# Altium schematic sheet KPILL.SchDoc
size A3; SheetNumber: 1; SheetTotal: 1
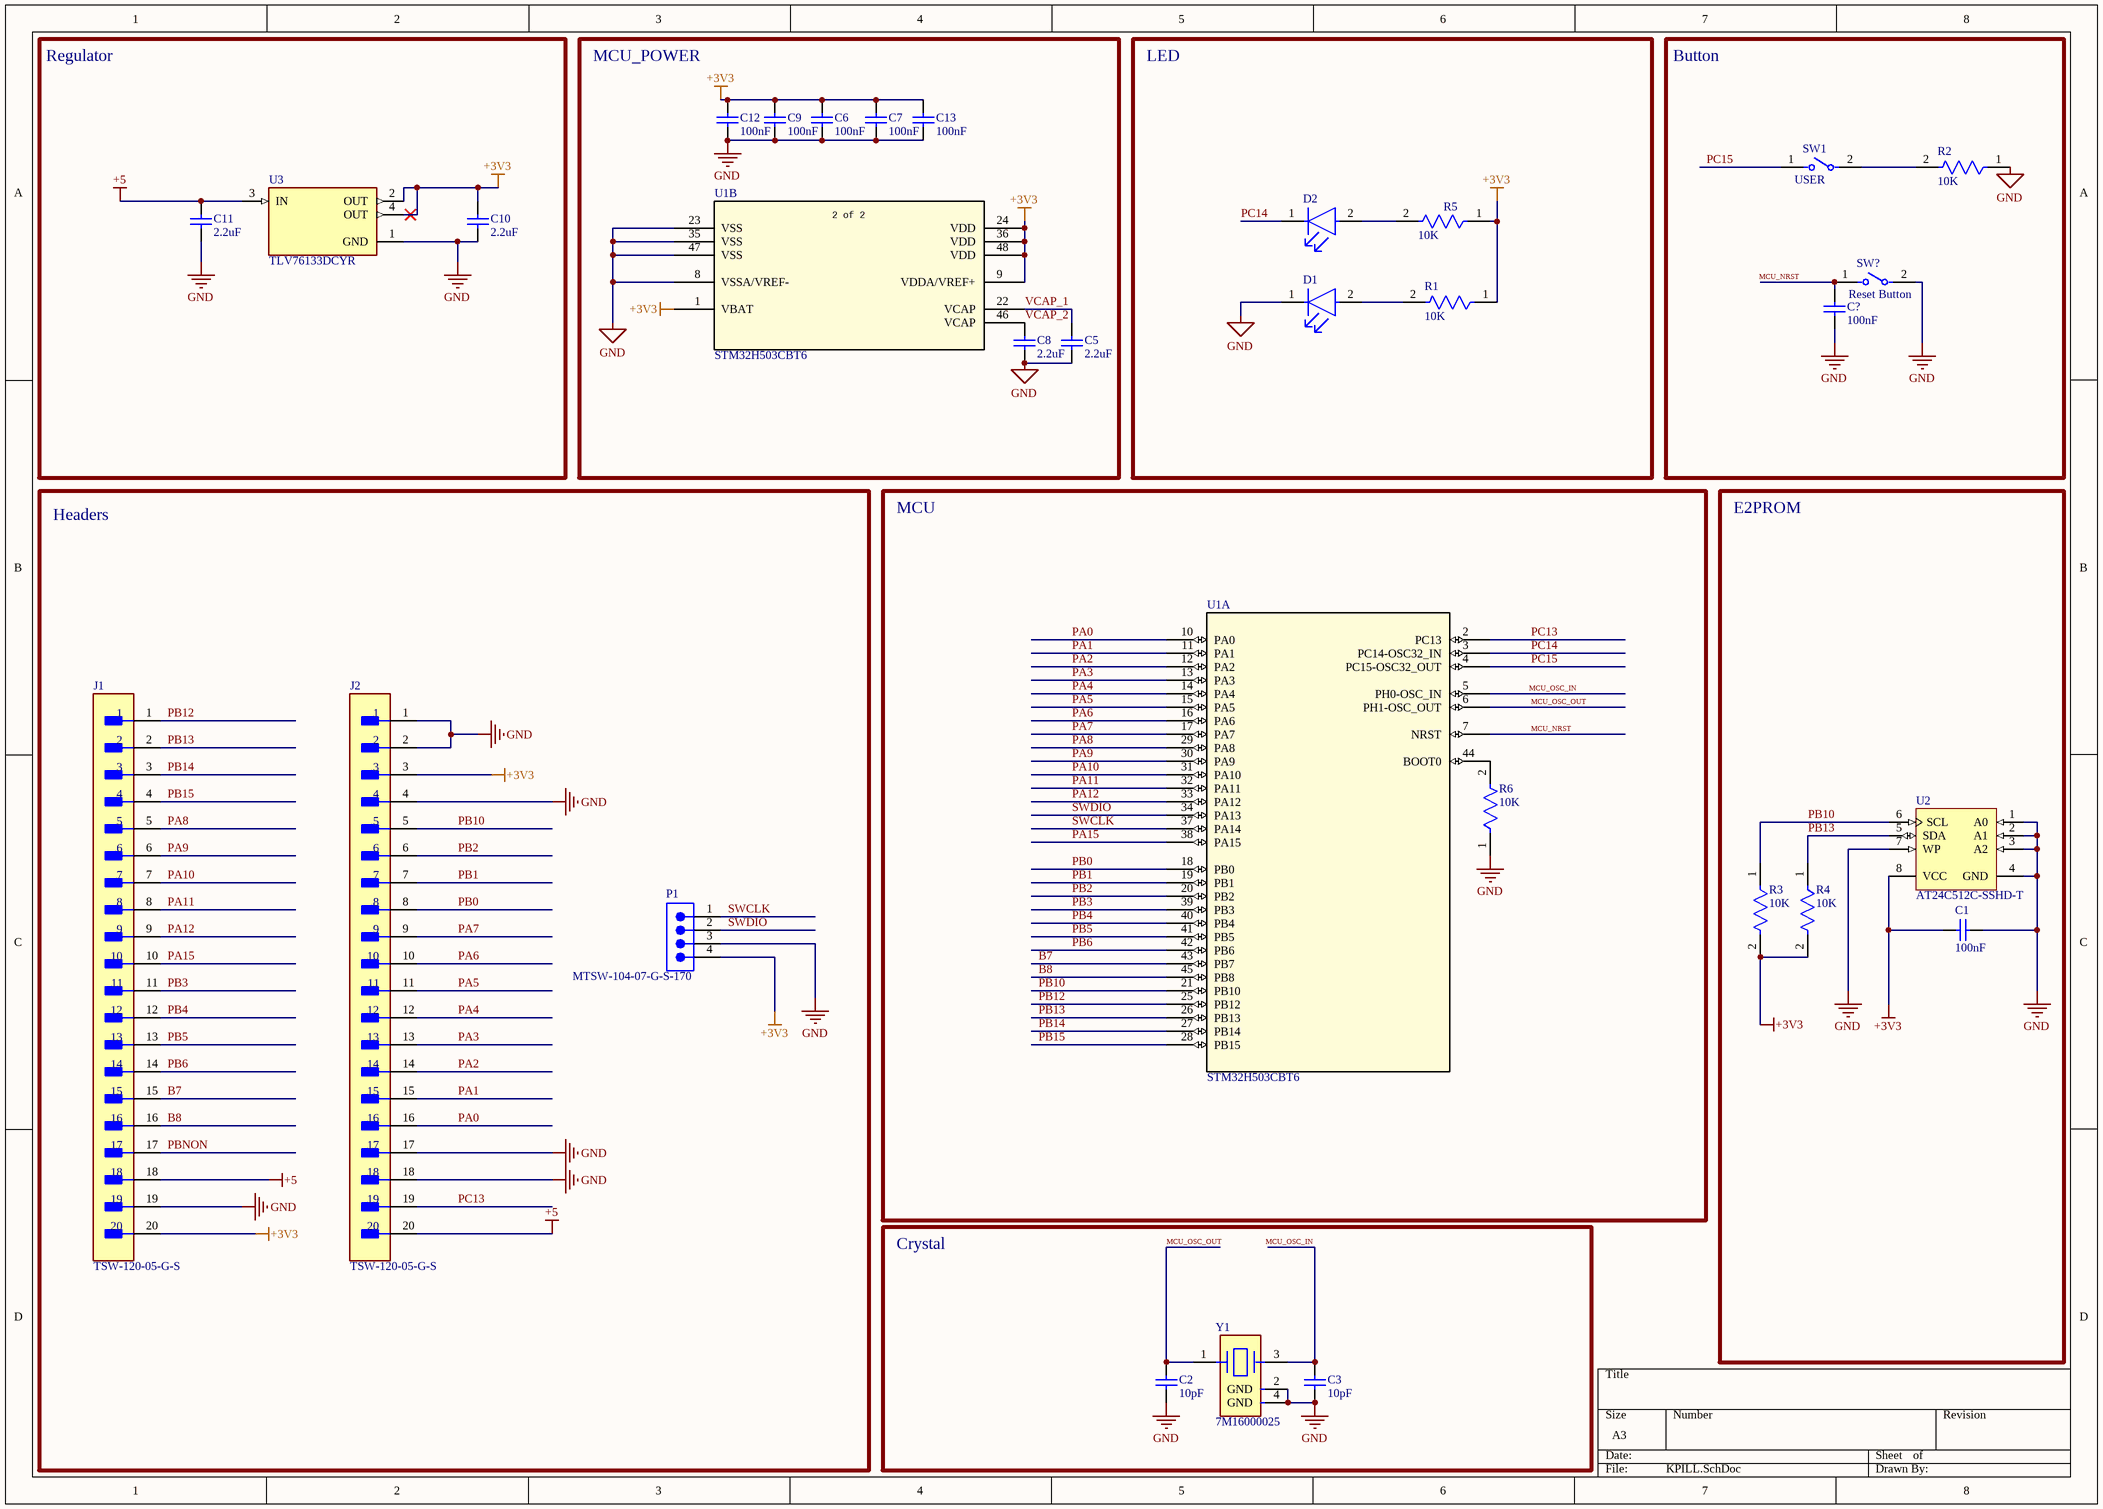
[diagram p0: KPILL.SchDoc]

## Parts
C1  100nF  [CAPC1608X90X35LL15T15]
C2  10pF  [CAPC1608X90X35LL15T15]
C3  10pF  [CAPC1608X90X35LL15T15]
C5  2.2uF  [CAPC1608X90X35LL15T15]
C6  100nF  [CAPC1608X90X35LL15T15]
C7  100nF  [CAPC1608X90X35LL15T15]
C8  2.2uF  [CAPC1608X90X35LL15T15]
C9  100nF  [CAPC1608X90X35LL15T15]
C10  2.2uF  [CAPC1608X90X35LL15T15]
C11  2.2uF  [CAPC1608X90X35LL15T15]
C12  100nF  [CAPC1608X90X35LL15T15]
C13  100nF  [CAPC1608X90X35LL15T15]
C?  100nF  [CAPC1608X90X35LL15T15]
D1  SML-LX0805UWC-TR  [FP-SML-LX0805UWC-TR-MFG]  (value not drawn)
D2  SML-LX0805UWC-TR  [FP-SML-LX0805UWC-TR-MFG]  (value not drawn)
J1  TSW-120-05-G-S  [FP-TSW-120-05-G-S-MFG]
J2  TSW-120-05-G-S  [FP-TSW-120-05-G-S-MFG]
P1  MTSW-104-07-G-S-170  [SMTC-MTSW-104-07-X-S-170]
R1  10K  [FP-AT0603-IPC_C]
R2  10K  [FP-AT0603-IPC_C]
R3  10K  [FP-AT0603-IPC_C]
R4  10K  [FP-AT0603-IPC_C]
R5  10K  [FP-AT0603-IPC_C]
R6  10K  [FP-AT0603-IPC_C]
SW1  USER  [FP-147873-2-MFG]
SW?  Reset Button  [FP-147873-2-MFG]
U1  STM32H503CBT6  [LQFP48-7x7mm_STM]  (parts A,B of 2)
U2  AT24C512C-SSHD-T  [ATML-8S1_L]
U3  TLV76133DCYR  [FP-DCY0004A-MFG]
Y1  7M16000025  [FP-7M-MFG]

## Blocks framed on the sheet
Regulator: C10 C11 U3
MCU_POWER: C5-C9 C12 C13 U1
LED: D1 D2 R1 R5
Button: C? R2 SW1 SW?
Headers: J1 J2 P1
MCU: R6 U1
E2PROM: C1 R3 R4 U2
Crystal: C2 C3 Y1

## Nets
+3V3: C1.2 C6.2 C7.2 C9.2 C10.2 C12.2 C13.2 J1.20 J2.3 P1.4 R1.1 R3.2 R4.2 R5.1 U1.1(VBAT) U1.9(VDDA/VREF+) U1.24(VDD) U1.36(VDD) U1.48(VDD) U2.8(VCC) U3.2(OUT) U3.4(OUT)
+5: C11.2 J1.18 J2.20 U3.3(IN)
GND: C1.1 C2.1 C3.2 C5.1 C6.1 C7.1 C8.1 C9.1 C10.1 C11.1 C12.1 C13.1 C?.2 D1.1(C) J1.19 J2.1 J2.2 J2.4 J2.17 J2.18 P1.3 R2.1 R6.1 SW?.2 U1.8(VSSA/VREF-) U1.23(VSS) U1.35(VSS) U1.47(VSS) U2.1(A0) U2.2(A1) U2.3(A2) U2.4(GND) U2.7(WP) U3.1(GND) Y1.2(GND) Y1.4(GND)
B7: J1.15 U1.43(PB7)
B8: J1.16 U1.45(PB8)
MCU_NRST: C?.1 SW?.1 U1.7(NRST)
MCU_OSC_IN: C3.1 U1.5(PH0-OSC_IN) Y1.3
MCU_OSC_OUT: C2.2 U1.6(PH1-OSC_OUT) Y1.1
PA0: J2.16 U1.10(PA0)
PA1: J2.15 U1.11(PA1)
PA2: J2.14 U1.12(PA2)
PA3: J2.13 U1.13(PA3)
PA4: J2.12 U1.14(PA4)
PA5: J2.11 U1.15(PA5)
PA6: J2.10 U1.16(PA6)
PA7: J2.9 U1.17(PA7)
PA8: J1.5 U1.29(PA8)
PA9: J1.6 U1.30(PA9)
PA10: J1.7 U1.31(PA10)
PA11: J1.8 U1.32(PA11)
PA12: J1.9 U1.33(PA12)
PA15: J1.10 U1.38(PA15)
PB0: J2.8 U1.18(PB0)
PB1: J2.7 U1.19(PB1)
PB2: J2.6 U1.20(PB2)
PB3: J1.11 U1.39(PB3)
PB4: J1.12 U1.40(PB4)
PB5: J1.13 U1.41(PB5)
PB6: J1.14 U1.42(PB6)
PB10: J2.5 R3.1 U1.21(PB10) U2.6(SCL)
PB12: J1.1 U1.25(PB12)
PB13: J1.2 R4.1 U1.26(PB13) U2.5(SDA)
PB14: J1.3 U1.27(PB14)
PB15: J1.4 U1.28(PB15)
PBNON: J1.17
PC13: J2.19 U1.2(PC13)
PC14: D2.1(C) U1.3(PC14-OSC32_IN)
PC15: SW1.1 U1.4(PC15-OSC32_OUT)
SWCLK: P1.1 U1.37(PA14)
SWDIO: P1.2 U1.34(PA13)
VCAP_1: C5.2 U1.22(VCAP)
VCAP_2: C8.2 U1.46(VCAP)
NetD1_2: D1.2(A) R1.2
NetD2_2: D2.2(A) R5.2
NetR2_2: R2.2 SW1.2
NetR6_2: R6.2 U1.44(BOOT0)

## Notes on the sheet
- (in symbol STM32H503CBT6, part B) 2 of 2

## Library data of the parts
C1-C3 C5-C13 C? = CMP-2006-04453-1: Manufacturer: AVX Interconnect / Elco; Part Number: 06035C682KAT4A
D1 D2 = CMP-00229-00139794-1: SML-LX0805UWC-TR White LED, 0805 Diffused, Rectangle Lens SMD package; NexarPartId: 139794; Approvals: CSA, UL; Lens Color: Clear, Yellow; Luminous Intensity: 150mcd; Power Rating: 120mW; Forward Current: 20mA; Forward Voltage: 3.5V; Number of LEDs: 1; Viewing Angle: 120°; RoHS: Compliant; Case/Package: 0805; Illumination Color: White; Min Operating Temperature: -40°C; Mount: Surface Mount; Max Operating Temperature: 85°C
J1 J2 = CMP-00575-00271415-1: TSW-120-05-G-S Headers & Wire Housings Classic PCB Header Strips, 0.100 pitch; NexarPartId: 271415; Manufacturer Lifecycle Status: PRODUCTION; Number of Contacts: 20; Gender: Male; Pitch: 2.54mm; Connector Type: Male Pin; Lead Free: Lead Free; Housing Material: Plastic; RoHS: Compliant; Housing Color: Black; Width: 2.54mm; Height: 2.54mm; Contact Plating: Gold; Lead Pitch: 2.54mm; Color: Black; Number of Positions: 20; Lifecycle Status: Production; Contact Material: Bronze; Contact Mating Length: 2.667mm; Length: 50.8mm; REACH SVHC: No SVHC; Termination: Solder; Mount: Through Hole; Number of Rows: 1
P1 = CMP-1024-00104-1: Modified .025" SQ Post Header, Through-hole, Vertical, -55 to 125 degC, 2.54 mm Pitch, 4-Pin, Male, RoHS; Manufacturer: Samtec; Pitch: 2.54 mm; Temperature Range: -55 to 125 degC; ComponentLink1URL: http://www.samtec.com; ComponentLink1Description: Manufacturer URL; ComponentLink3URL: http://www.samtec.com/documents/webfiles/cpdf/MTSW-XXX-XX-X-X-XXXX-XX-XXX-MKT1.pdf; DatasheetVersion: F-214; Orientation: Vertical; ComponentLink3Description: Package Specification; PackageReference: MTSW-104-07-X-S-170; PackageDescription: Assembly .025" [.64] SQ Post Terminal Strip; ComponentLink2Description: Datasheet; PackageVersion: BI, 2/1987; ComponentLink2URL: http://www.samtec.com/documents/webfiles/pdf/MTSW.PDF; PartNumber: MTSW-104-07-G-S-170; Mounting Technology: Through-hole; RoHS: True
R1-R6 = CMP-03412-014529-2: Thin Film Chip Resistors Automotive Grade 10kΩ 0.5% 50ppm/°C 0603; Resistance: 10kR; Max Power Dissipation: 100mW; Ratings: AEC-Q200; Number of Terminations: 2; Case Code (Metric): 1608; Series: AT; Length: 0.063inch; Min Operating Temperature: -55°C; Features: Moisture Resistant; Case/Package: 0603; RoHS Compliant: Yes; Temperature Coefficient: 50ppm/°C; Case Code (Imperial): 0603; Tolerance: 0.5%; Resistor Type: Thin Film; Max Operating Temperature: 155°C; Packaging: Cut Tape; Width: 0.032inch; Height: 0.022inch
SW1 SW? = CMP-03402-000024-1: SWITCH TACTILE SPST-NO 0.05A 24V; Contact Current Rating: 50mA; Mechanical Life: 40000Cycles; Actuator Length: 0.031inch; Operating Force: 1.77N; Contact Resistance: 100mR; Max Voltage Rating (DC): 12V; Illumination Type: Non-Illuminated; Switch Function: Off-Mom; Actuator Material: Polyphenylene; Throw Configuration: SPST; Switch Travel: 0.25mm; Housing Material: Thermoplastic; Package Quantity: 1; Contact Plating: Silver; Depth: 6.8mm; Electrical Life: 40000Cycles; Color: Black; Length: 3.5mm; Size: 6mm; Material: Polyamide; Height: 4.3mm; Current Rating: 50mA; Case/Package: SMD/SMT; Packaging: Tape and Reel; Mount: Surface Mount; RoHS Compliant: Yes; Voltage Rating (DC): 12V; Max Operating Temperature: 85°C; ELV: Compliant; Min Operating Temperature: -35°C; Lead Free: Lead Free; Termination: J-Bend; Orientation: Straight; Max Current Rating: 50mA; Radiation Hardening: No; Type: Switch; Contact Material: Copper Alloy; Series: FSMJM, Alcoswitch
U1 = STM32H503CBT6: High-performance, Arm Cortex-M33, MCU with 128-Kbyte Flash, 32-Kbyte RAM, 250 MHz CPU; Manufacturer_Name: STMicroelectronics; Copyright: Copyright (C) 2025 Ultra Librarian. All rights reserved.; Manufacturer_Part_Number: STM32H503CBT6; RefDes: RefDes; Type: Type
U2 = CMP-2000-05801-1: 512-Kbit (65,536 x 8), 2-Wire Bus Serial EEPROM with Write Protect, 2.5 to 5.5 V, -40 to 85 degC, 8-Pin SOIC (8S1), RoHS, Tape and Reel; Manufacturer: Atmel; Data Retention: 40Year; Maximum Random Access Time: 550ns; Maximum Operating Frequency: 1MHz; Typical Operating Supply Voltage: 3.3; Organization: 64Kx8; Hardware Data Protection: Yes; Interface Type: Serial(2-Wire); Density: 512Kb; Operating Temperature: -40to85°C; Package Reference: 8S1; Datasheet URL: http://www.atmel.com/Images/Atmel-8720-SEEPROM-AT24C512C-Datasheet.pdf; Package Description: 8-Pin Small Outline Integrated Circuit, Body 4.925 x 3.9 mm, Pitch 1.27 mm; Mounting Technology: SurfaceMount; Manufacturer URL: http://www.atmel.com/; Category: EEPROM; Package: 8SOIC; Datasheet Version: Rev. 8720G, 09/2015
U3 = CMP-00370-135533165-1: TLV76133DCYR 1A 16V high-PSRR linear voltage regulator 4-SOT-223 -40 to 125; Manufacturer Lifecycle Status: ACTIVE; Output Voltage: 3.3V; Accuracy: 1%; Max Junction Temperature (Tj): 125°C; Min Supply Voltage: 4.8V; Dropout Voltage: 900mV; Number of Outputs: 1; Nominal Supply Current: 65µA; Height: 1.8mm; Width: 3.5mm; Max Supply Voltage: 16V; NexarPartId: 135533165; Max Operating Temperature: 125°C; Min Operating Temperature: -40°C; Length: 6.5mm; Lifecycle Status: Production; Case/Package: SOT-223; Number of Pins: 4; Output Current: 1A; Thickness: 1.6mm; P.N: TLV76133DCYR; ComponentLink1Description: Supplier Link; ComponentLink1URL: https://lionelectronic.ir/products/6357-TLV76133DCYR
Y1 = CMP-18717-000306-1: Crystal 16MHz, 10ppm, 20pF, 60Ω; Case/Package: SMD/SMT; Height: 0.031inch; Mount: Surface Mount; Max Operating Temperature: 70°C; Frequency: 16MHz; Width: 0.098inch; Frequency Tolerance: 10ppm; Frequency Stability: 10ppm; Load Capacitance: 20pF; Length: 0.126inch; Min Operating Temperature: -20°C